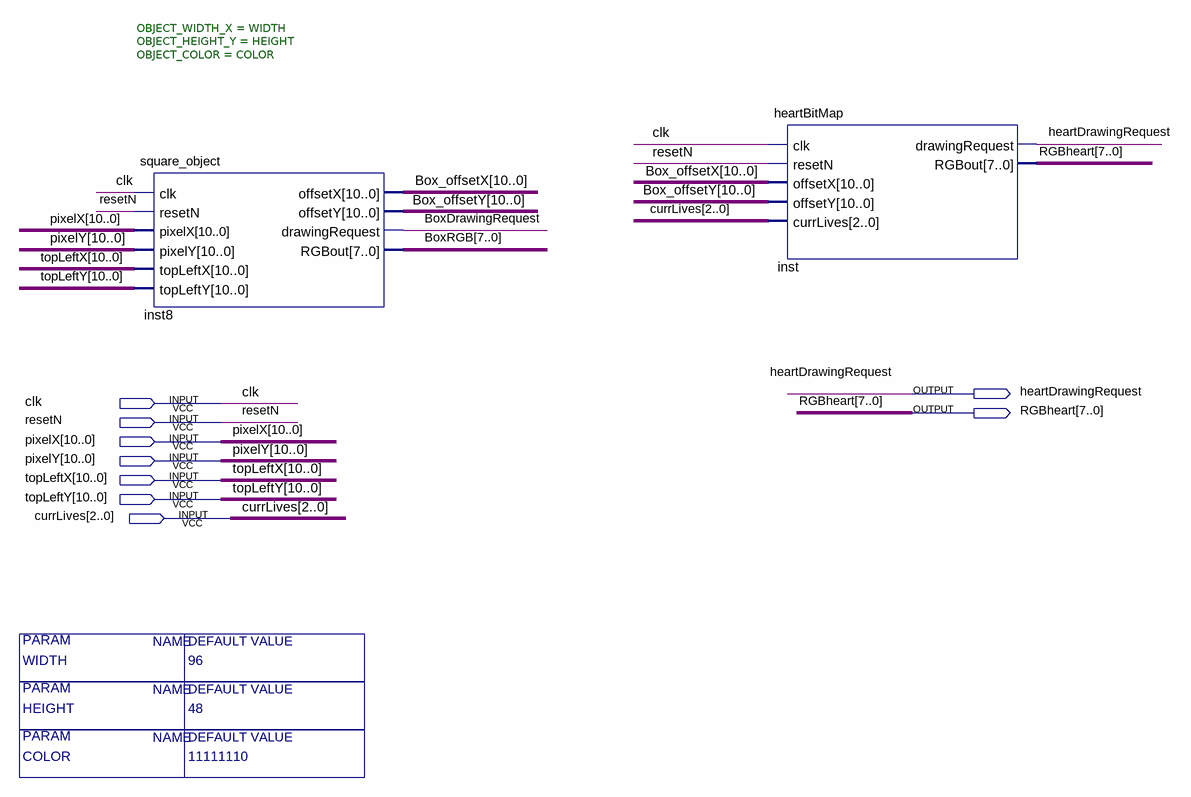
[diagram p0: schematic sheet]
// Quartus schematic heart.bdf as structural Verilog: 2 symbols, 9 pins
module heart #(parameter COLOR = 11111110, parameter HEIGHT = 48, parameter WIDTH = 96) (
  input  clk,
  input  resetN,
  input  [10:0] pixelX,
  input  [10:0] pixelY,
  input  [10:0] topLeftX,
  input  [10:0] topLeftY,
  input  [2:0] currLives,
  output heartDrawingRequest,
  output [7:0] RGBheart
);

  wire BoxDrawingRequest;
  wire [7:0] BoxRGB;
  wire [10:0] Box_offsetX, Box_offsetY;

  square_object #(.OBJECT_WIDTH_X(WIDTH), .OBJECT_HEIGHT_Y(HEIGHT), .OBJECT_COLOR(COLOR)) inst8 (
    .clk(clk), .resetN(resetN), .pixelX(pixelX), .pixelY(pixelY), .topLeftX(topLeftX), .topLeftY(topLeftY),
    .offsetX(Box_offsetX), .offsetY(Box_offsetY), .drawingRequest(BoxDrawingRequest), .RGBout(BoxRGB));
  heartBitMap inst (
    .clk(clk), .resetN(resetN), .offsetX(Box_offsetX), .offsetY(Box_offsetY), .currLives(currLives),
    .drawingRequest(heartDrawingRequest), .RGBout(RGBheart));
endmodule
